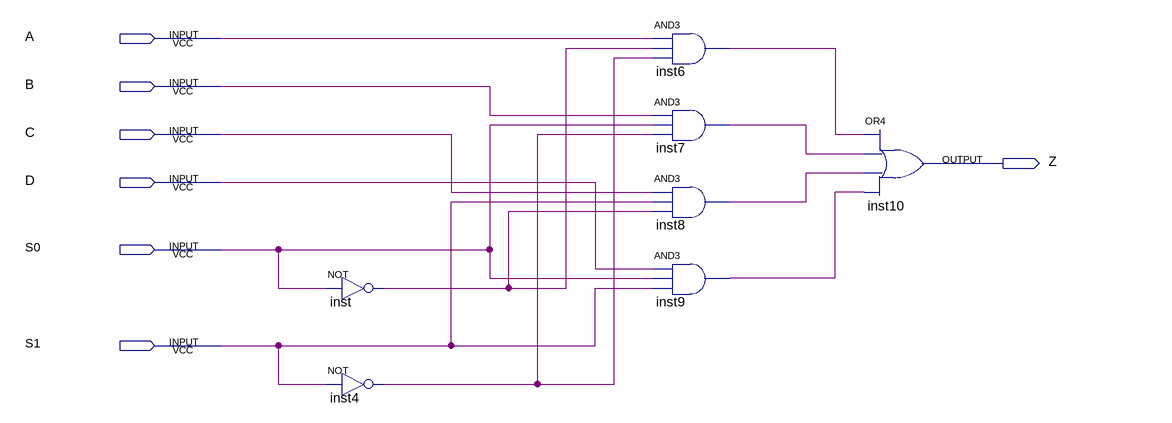
[diagram p0: schematic sheet]
// Quartus schematic Lab12.bdf as structural Verilog: 7 symbols, 7 pins
module Lab12 (
  input  A,
  input  B,
  input  C,
  input  D,
  input  S0,
  input  S1,
  output Z
);

  wire inst4_out, inst6_out, inst7_out, inst8_out, inst9_out, inst_out;

  not inst (inst_out, S0);
  not inst4 (inst4_out, S1);
  and inst6 (inst6_out, A, inst_out, inst4_out);
  and inst7 (inst7_out, B, S0, inst4_out);
  and inst8 (inst8_out, C, S1, inst_out);
  and inst9 (inst9_out, D, S0, S1);
  or inst10 (Z, inst6_out, inst7_out, inst8_out, inst9_out);
endmodule
